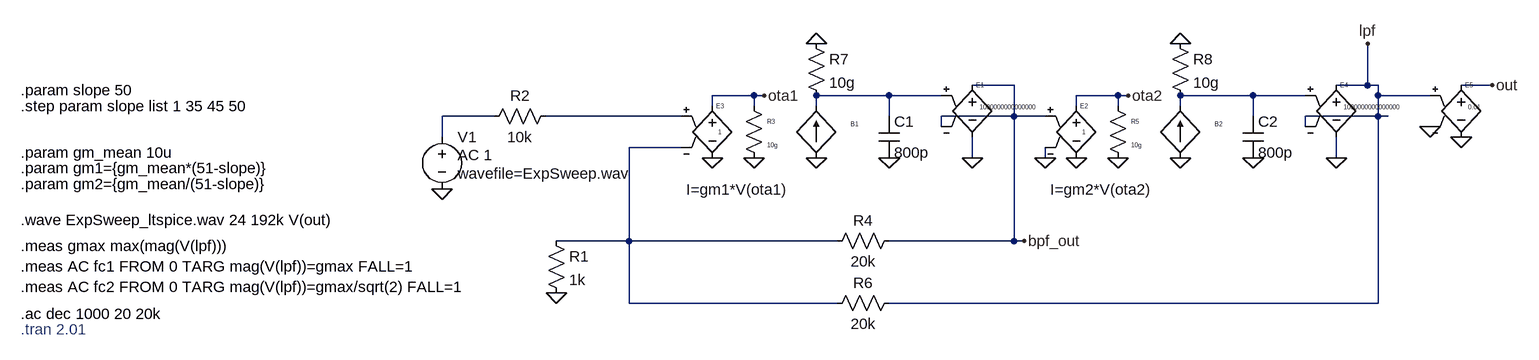
[diagram p0: schematic ltspice_comparison.asc]
ltspice_comparison.asc, the LTspice schematic file:
Version 4.1
SHEET 1 7824 1012
WIRE 2320 -256 2256 -256
WIRE 2864 -256 2864 -320
WIRE 2864 -256 2816 -256
WIRE 2880 -256 2864 -256
WIRE 3056 -256 3008 -256
WIRE 1920 -240 1856 -240
WIRE 1936 -240 1920 -240
WIRE 2128 -240 2016 -240
WIRE 2208 -240 2128 -240
WIRE 2480 -240 2416 -240
WIRE 2496 -240 2480 -240
WIRE 2688 -240 2576 -240
WIRE 2768 -240 2688 -240
WIRE 2880 -240 2880 -256
WIRE 2960 -240 2880 -240
WIRE 1856 -224 1856 -240
WIRE 1920 -224 1920 -240
WIRE 2016 -224 2016 -240
WIRE 2416 -224 2416 -240
WIRE 2480 -224 2480 -240
WIRE 2576 -224 2576 -240
WIRE 1520 -208 1440 -208
WIRE 1808 -208 1600 -208
WIRE 2128 -208 2128 -240
WIRE 2320 -208 2320 -256
WIRE 2320 -208 2208 -208
WIRE 2368 -208 2320 -208
WIRE 2688 -208 2688 -240
WIRE 2880 -208 2880 -240
WIRE 2880 -208 2768 -208
WIRE 2896 -208 2880 -208
WIRE 2208 -192 2208 -208
WIRE 2768 -192 2768 -208
WIRE 1440 -176 1440 -208
WIRE 1808 -160 1728 -160
WIRE 2256 -144 2256 -176
WIRE 2368 -144 2368 -160
WIRE 2816 -144 2816 -176
WIRE 1728 -16 1728 -160
WIRE 1728 -16 1616 -16
WIRE 2048 -16 1728 -16
WIRE 2320 -16 2320 -208
WIRE 2320 -16 2128 -16
WIRE 2336 -16 2320 -16
WIRE 1728 80 1728 -16
WIRE 2048 80 1728 80
WIRE 2880 80 2880 -208
WIRE 2880 80 2128 80
FLAG 1856 -144 0
FLAG 2016 -144 0
FLAG 1920 -144 0
FLAG 1936 -240 ota1
FLAG 2256 -144 0
FLAG 2128 -144 0
FLAG 1440 -96 0
FLAG 1616 64 0
FLAG 2416 -144 0
FLAG 2576 -144 0
FLAG 2480 -144 0
FLAG 2496 -240 ota2
FLAG 2816 -144 0
FLAG 2688 -144 0
FLAG 2368 -144 0
FLAG 2336 -16 bpf_out
FLAG 2864 -320 lpf
FLAG 2016 -320 0
FLAG 2576 -320 0
FLAG 3008 -176 0
FLAG 2960 -192 0
FLAG 3056 -256 out
SYMBOL bi 2016 -144 R180
WINDOW 0 -65 52 Left 0
WINDOW 3 200 -49 Right 2
SYMATTR InstName B1
SYMATTR Value I=gm1*V(ota1)
SYMBOL e 1856 -240 R0
WINDOW 0 6 16 Left 0
WINDOW 3 9 56 Left 0
SYMATTR InstName E3
SYMATTR Value 1
SYMBOL res 1904 -240 R0
WINDOW 0 36 40 Left 0
WINDOW 3 36 76 Left 0
SYMATTR InstName R3
SYMATTR Value 10g
SYMBOL e 2256 -272 R0
WINDOW 0 6 16 Left 0
WINDOW 3 11 50 Left 0
SYMATTR InstName E1
SYMATTR Value 1000000000000000
SYMBOL cap 2112 -208 R0
SYMATTR InstName C1
SYMATTR Value 800p
SYMBOL voltage 1440 -192 R0
WINDOW 123 24 44 Left 2
WINDOW 39 0 0 Left 0
WINDOW 3 24 72 Left 2
SYMATTR Value2 AC 1
SYMATTR Value wavefile=ExpSweep.wav
SYMATTR InstName V1
SYMBOL res 1616 -224 R90
WINDOW 0 0 56 VBottom 2
WINDOW 3 32 56 VTop 2
SYMATTR InstName R2
SYMATTR Value 10k
SYMBOL res 1600 -32 R0
SYMATTR InstName R1
SYMATTR Value 1k
SYMBOL res 2144 -32 R90
WINDOW 0 0 56 VBottom 2
WINDOW 3 32 56 VTop 2
SYMATTR InstName R4
SYMATTR Value 20k
SYMBOL bi 2576 -144 R180
WINDOW 0 -65 52 Left 0
WINDOW 3 200 -49 Right 2
SYMATTR InstName B2
SYMATTR Value I=gm2*V(ota2)
SYMBOL e 2416 -240 R0
WINDOW 0 6 16 Left 0
WINDOW 3 9 56 Left 0
SYMATTR InstName E2
SYMATTR Value 1
SYMBOL res 2464 -240 R0
WINDOW 0 36 40 Left 0
WINDOW 3 36 76 Left 0
SYMATTR InstName R5
SYMATTR Value 10g
SYMBOL e 2816 -272 R0
WINDOW 0 6 16 Left 0
WINDOW 3 11 50 Left 0
SYMATTR InstName E4
SYMATTR Value 1000000000000000
SYMBOL cap 2672 -208 R0
SYMATTR InstName C2
SYMATTR Value 800p
SYMBOL res 2144 64 R90
WINDOW 0 0 56 VBottom 2
WINDOW 3 32 56 VTop 2
SYMATTR InstName R6
SYMATTR Value 20k
SYMBOL res 2000 -336 R0
SYMATTR InstName R7
SYMATTR Value 10g
SYMBOL res 2560 -336 R0
SYMATTR InstName R8
SYMATTR Value 10g
SYMBOL e 3008 -272 R0
WINDOW 0 6 16 Left 0
WINDOW 3 11 50 Left 0
SYMATTR InstName E5
SYMATTR Value 0.01
TEXT 792 -128 Left 2 !.param gm1={gm_mean*(51-slope)}
TEXT 792 -104 Left 2 !.param gm2={gm_mean/(51-slope)}
TEXT 792 96 Left 2 !.ac dec 1000 20 20k
TEXT 792 -152 Left 2 !.param gm_mean 10u
TEXT 792 -248 Left 2 !.param slope 50
TEXT 792 -224 Left 2 !.step param slope list 1 35 45 50
TEXT 792 -48 Left 2 !.wave ExpSweep_ltspice.wav 24 192k V(out)
TEXT 792 120 Left 2 ;.tran 2.01
TEXT 792 -8 Left 2 !.meas gmax max(mag(V(lpf)))\n.meas AC fc1 FROM 0 TARG mag(V(lpf))=gmax FALL=1\n.meas AC fc2 FROM 0 TARG mag(V(lpf))=gmax/sqrt(2) FALL=1

The netlist it stands for:
* ltspice_comparison.asc
B1 0 N001 I=gm1*V(ota1)
E3 ota1 0 N004 N005 1
R3 ota1 0 10g
E1 bpf_out 0 N001 bpf_out 1000000000000000
C1 N001 0 800p
V1 N003 0 wavefile=ExpSweep.wav AC 1
R2 N004 N003 10k
R1 N005 0 1k
R4 bpf_out N005 20k
B2 0 N002 I=gm2*V(ota2)
E2 ota2 0 bpf_out 0 1
R5 ota2 0 10g
E4 lpf 0 N002 lpf 1000000000000000
C2 N002 0 800p
R6 lpf N005 20k
R7 0 N001 10g
R8 0 N002 10g
E5 out 0 lpf 0 0.01
.param gm1={gm_mean*(51-slope)}
.param gm2={gm_mean/(51-slope)}
.ac dec 1000 20 20k
.param gm_mean 10u
.param slope 50
.step param slope list 1 35 45 50
.wave ExpSweep_ltspice.wav 24 192k V(out)
* .tran 2.01
.meas gmax max(mag(V(lpf)))
.meas AC fc1 FROM 0 TARG mag(V(lpf))=gmax FALL=1
.meas AC fc2 FROM 0 TARG mag(V(lpf))=gmax/sqrt(2) FALL=1
.backanno
.end